# Altium schematic sheet Sheet1.SchDoc
size A; SheetNumber: 1; SheetTotal: 1
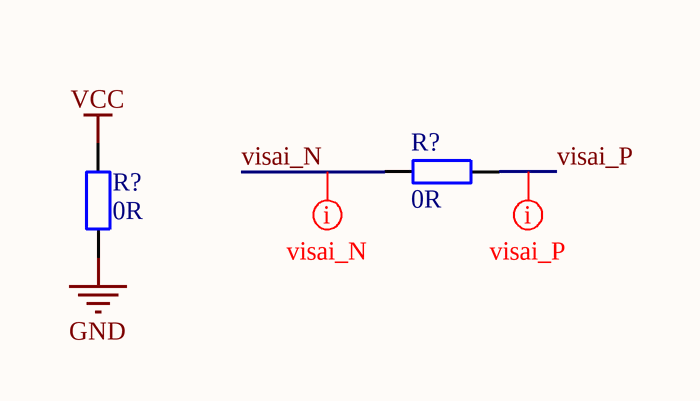
[diagram p0: Sheet1.SchDoc]

## Parts
(Parts that share a designator on the sheet are numbered #1, #2 ... from top to bottom, then left to right.)
R?#1  0R  [tro smd 0603]
R?#2  0R  [tro smd 0603]

## Nets
GND: R?#2.1
VCC: R?#2.2
visai_N: R?#1.2
visai_P: R?#1.1

## Layout directives
differential pair: visai_N, visai_P

## Library data of the parts
R?#1 R?#2 = Tro 0603 1% 0R: Dán; Don_Vi: Con; So_Chan: 2; Ten_Linh_Kien: Trở 0603 1% 0R; Ma_Hang: MH005792; Chung_Loai: Dán; Kieu_Chan: *